# EasyEDA Pro project htx-studio-project_kpilekig-42ad306f.epro, board Adapter
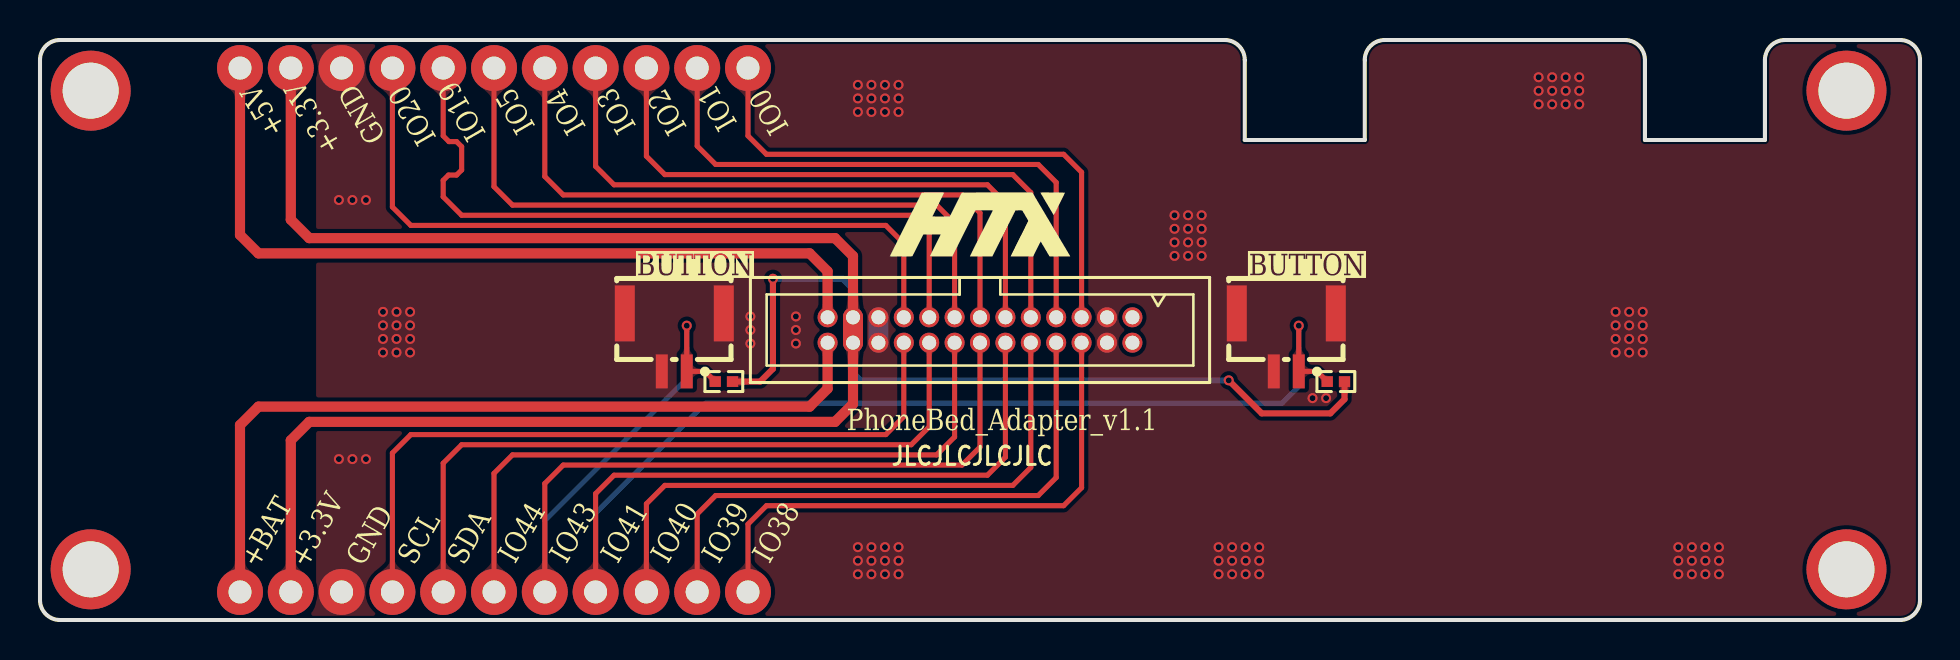
[diagram p10: board, top side]
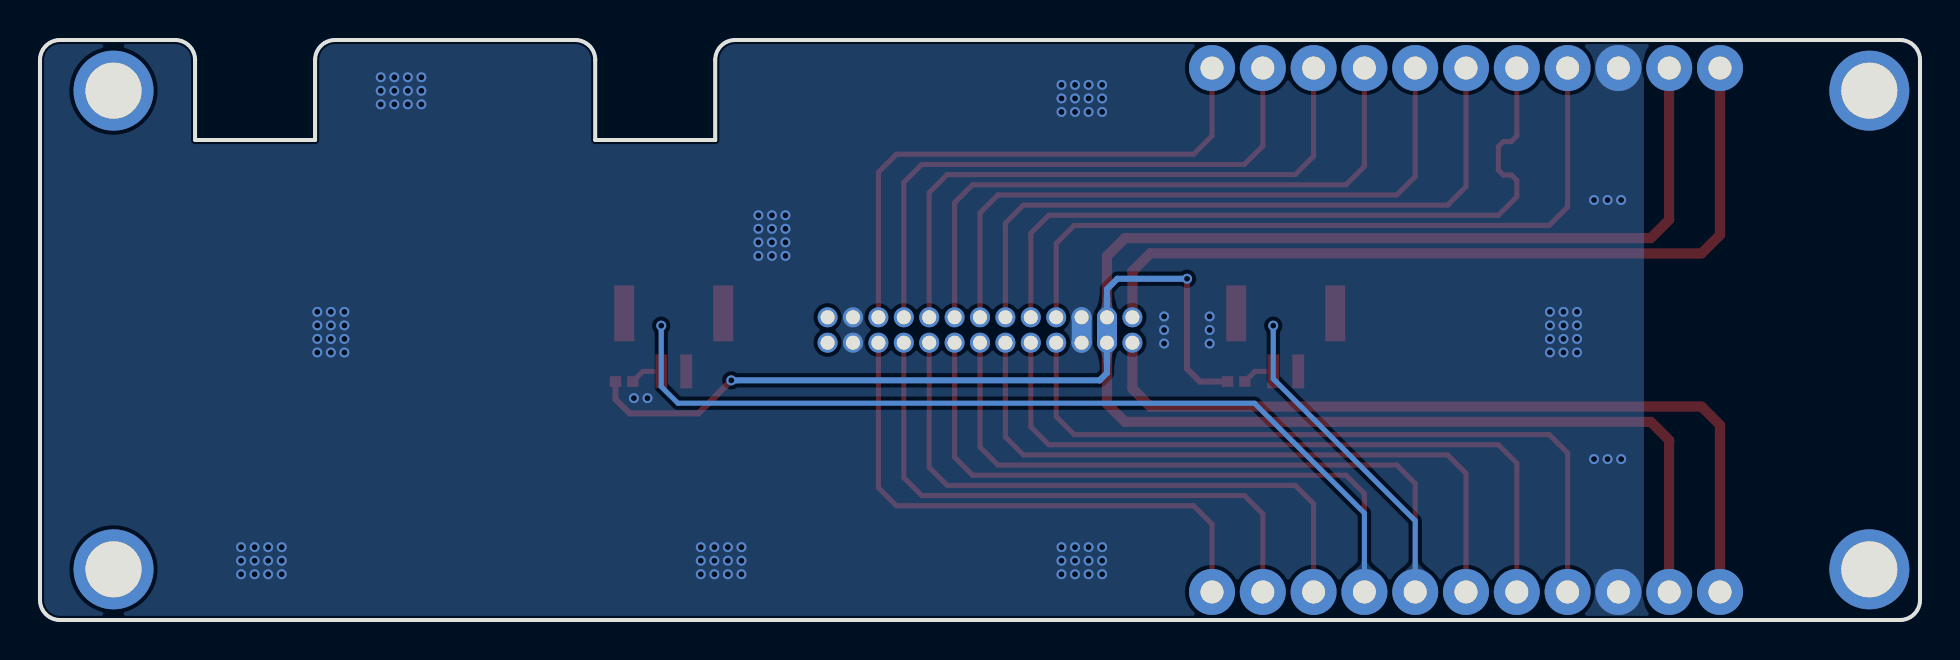
[diagram p11: board, bottom side, seen from below]

Outline 94 x 29 mm; copper layers: Top Layer, Bottom Layer. Coordinates in mm from the lower left corner of the outline.
Outline path: 0,28 arc(0.29,28.71) 1,29 59.24,29 arc(59.95,28.71) 60.24,28 60.24,24 66.24,24 66.24,28 arc(66.53,28.71) 67.24,29 79.25,29 arc(79.95,28.71) 80.25,28 80.25,24 86.25,24 86.25,28 arc(86.54,28.71) 87.25,29 93,29 arc(93.71,28.71) 94,28 94,1 arc(93.71,0.29) 93,0 1,0 arc(0.29,0.29) 0,1 0,28
Stack: Top Layer 0.035mm / Dielectric1 1.51mm FR4 er 4.5 / Bottom Layer 0.035mm

## Design rules (mm)
spacing copperThickness1oz (default): track to track 0.102, other pairs 0.152 to 0.3
spacing copperThickness2oz: track to track 0.203, other pairs 0.152 to 0.3
spacing Plane_innerPlane: track to track 0.102, other pairs 0.152 to 0.3
spacing Copper_copperRegion: track to track 0.102, other pairs 0.152 to 0.3
track width copperThickness1oz (default): min 0.127, default 0.254, max 2.54
track width copperThickness2oz: min 0.203, default 0.254, max 2.54
differential pair differentialPair (default): width min 0.127, default 0.254, max 2.54; gap min 0.152, default 0.152
pour e259 uses Copper_copperRegion
pour e265 uses Copper_copperRegion

## Placement (name value [footprint] x y rotation side)
CN1  X1270WV-2x13A-9TV01  [IDC-TH_X1270WV-2X13A-6TV01]  47 14.5 180 top
CN3  WAFER-GH1.25-2PWB  [CONN-TH_2P-P1.25_XUNPU_WAFER-GH1.25-2PWB]  31.71 13.88 180 top
CN4  WAFER-GH1.25-2PWB  [CONN-TH_2P-P1.25_XUNPU_WAFER-GH1.25-2PWB]  62.31 13.88 180 top
H1  PZ254-1-11-Z-8.5  [HDR-TH_11P-P2.54-V-M]  22.7 27.6 0 top
H2  PZ254-1-11-Z-8.5  [HDR-TH_11P-P2.54-V-M]  22.7 1.4 0 top
NOREF  -  [Pad_e116]  90.32 2.53 0 top
NOREF#2  -  [Pad_e115]  90.32 26.47 0 top
NOREF#3  -  [Pad_e117]  2.53 26.47 0 top
NOREF#4  -  [Pad_e118]  2.53 2.53 0 top
R1  10kΩ  [R0402]  64.79 11.92 0 top
R2  10kΩ  [R0402]  34.19 11.92 0 top

## Footprints (pads in the part's own frame, mm; a bottom-side part is the same pattern mirrored in y, then rotated)
CONN-TH_2P-P1.25_XUNPU_WAFER-GH1.25-2PWB
  rect 0.6x1.7 smd: 1(-0.625,1.45) 2(0.625,1.45)
  rect 1x2.8 smd: 3(-2.475,-1.45) 4(2.475,-1.45)
HDR-TH_11P-P2.54-V-M
  round 2.3 hole 1.15: 1(-12.7,0) 2(-10.16,0) 3(-7.62,0) 4(-5.08,0) 5(-2.54,0) 6(0,0) 7(2.54,0) 8(5.08,0) 9(7.62,0) 10(10.16,0) 11(12.7,0)
IDC-TH_X1270WV-2X13A-6TV01
  round 1 hole 0.7: 1(-7.62,-0.635) 2(-7.62,0.635) 3(-6.35,-0.635) 4(-6.35,0.635) 5(-5.08,-0.635) 6(-5.08,0.635) 7(-3.81,-0.635) 8(-3.81,0.635) 9(-2.54,-0.635) 10(-2.54,0.635) 11(-1.27,-0.635) 12(-1.27,0.635) 13(0,-0.635) 14(0,0.635) 15(1.27,-0.635) 16(1.27,0.635) 17(2.54,-0.635) 18(2.54,0.635) 19(3.81,-0.635) 20(3.81,0.635) 21(5.08,-0.635) 22(5.08,0.635) 23(6.35,-0.635) 24(6.35,0.635) 25(7.62,-0.635) 26(7.62,0.635)
Pad_e115
  round 4 hole 2.8: 1(0,0)
Pad_e116
  round 4 hole 2.8: 1(0,0)
Pad_e117
  round 4 hole 2.8: 1(0,0)
Pad_e118
  round 4 hole 2.8: 1(0,0)
R0402
  rect 0.566x0.54 smd: 1(-0.433,0) 2(0.433,0)

## Nets
As in the schematic.

Pads without a net: CN1 1 2; NOREF 1; NOREF#2 1; NOREF#3 1; NOREF#4 1

## Via types
v1: diameter 0.5, hole 0.3, Top Layer to Bottom Layer, 114 vias

## Routing (per net, layer and track width the routed paths; a pad name or vN(x,y) marks a point on that pad's centre or on a via; arc(x,y) is an arc through that point)
+3.3V: length 122.1
  Top Layer w0.305: R1.2 65.23,11.04 64.52,10.33 61.09,10.33 v1(59.44,11.98) ; R2.2 36.01,11.92 36.65,12.56 v1(36.65,17.06)
  Top Layer w0.508: CN1.24 40.65,10.81 39.75,9.91 13.46,9.91 12.54,8.98 H2.2 ; H1.2 12.54,20.02 13.46,19.09 39.75,19.09 40.65,18.2 CN1.23
  Top Layer w1: CN1.23 CN1.24
  Bottom Layer w0.305: CN1.24 40.65,12.35 41.02,11.98 v1(59.44,11.98) ; CN1.23 40.65,16.54 40.13,17.06 v1(36.65,17.06)
  Bottom Layer w1: CN1.23 CN1.24
+5V: length 40.8
  Top Layer w0.508: CN1.25 39.38,17.43 38.48,18.33 10.92,18.33 10,19.25 10,27.6
GND: length 1.3
  Bottom Layer w1: CN1.22 CN1.21
  vias: v1(14.94,21) v1(14.94,8.05) v1(15.62,21) v1(15.62,8.05) v1(16.3,21) v1(16.3,8.05) v1(17.15,15.41) v1(17.15,14.73) v1(17.15,14.05) v1(17.15,13.38) v1(17.83,15.41) v1(17.83,14.73) v1(17.83,14.05) v1(17.83,13.38) v1(18.5,15.41) v1(18.5,14.73) v1(18.5,14.05) v1(18.5,13.38) v1(35.52,15.18) v1(35.52,14.5) v1(35.52,13.82) v1(37.79,15.18) v1(37.79,14.5) v1(37.79,13.82) v1(40.89,26.76) v1(40.89,26.08) v1(40.89,25.4) v1(40.89,3.64) v1(40.89,2.97) v1(40.89,2.29) v1(41.57,26.76) v1(41.57,26.08) v1(41.57,25.4) v1(41.57,3.64) v1(41.57,2.97) v1(41.57,2.29) v1(42.25,26.76) v1(42.25,26.08) v1(42.25,25.4) v1(42.25,3.64) v1(42.25,2.97) v1(42.25,2.29) v1(42.93,26.76) v1(42.93,26.08) v1(42.93,25.4) v1(42.93,3.64) v1(42.93,2.97) v1(42.93,2.29) v1(56.73,20.24) v1(56.73,19.56) v1(56.73,18.88) v1(56.73,18.21) v1(57.4,20.24) v1(57.4,19.56) v1(57.4,18.88) v1(57.4,18.21) v1(58.08,20.24) v1(58.08,19.56) v1(58.08,18.88) v1(58.08,18.21) v1(58.93,3.64) v1(58.93,2.97) v1(58.93,2.29) v1(59.61,3.64) v1(59.61,2.97) v1(59.61,2.29) v1(60.28,3.64) v1(60.28,2.97) v1(60.28,2.29) v1(60.96,3.64) v1(60.96,2.97) v1(60.96,2.29) v1(63.63,11.09) v1(64.3,11.09) v1(74.93,27.14) v1(74.93,26.46) v1(74.93,25.78) v1(75.61,27.14) v1(75.61,26.46) v1(75.61,25.78) v1(76.28,27.14) v1(76.28,26.46) v1(76.28,25.78) v1(76.96,27.14) v1(76.96,26.46) v1(76.96,25.78) v1(78.78,15.41) v1(78.78,14.73) v1(78.78,14.05) v1(78.78,13.38) v1(79.46,15.41) v1(79.46,14.73) v1(79.46,14.05) v1(79.46,13.38) v1(80.13,15.41) v1(80.13,14.73) v1(80.13,14.05) v1(80.13,13.38) v1(81.91,3.64) v1(81.91,2.97) v1(81.91,2.29) v1(82.59,3.64) v1(82.59,2.97) v1(82.59,2.29) v1(83.27,3.64) v1(83.27,2.97) v1(83.27,2.29) v1(83.95,3.64) v1(83.95,2.97) v1(83.95,2.29)
+BAT: length 40.8
  Top Layer w0.508: CN1.26 39.38,11.57 38.48,10.67 10.92,10.67 10,9.75 10,1.4
GPIO0: length 28.1
  Top Layer w0.254: CN1.5 52.08,22.39 51.18,23.29 36.32,23.29 35.4,24.21 35.4,27.6
GPIO1: length 29.3
  Top Layer w0.254: H1.10 32.86,23.7 33.78,22.78 49.91,22.78 50.81,21.88 CN1.7
GPIO2: length 30.6
  Top Layer w0.254: H1.9 30.32,23.19 31.24,22.27 48.64,22.27 49.54,21.37 CN1.9
GPIO3: length 31.9
  Top Layer w0.254: 27.78,27.6 27.78,22.68 28.7,21.76 47.37,21.76 48.27,20.86 CN1.11
GPIO4: length 33.2
  Top Layer w0.254: H1.7 25.24,22.18 26.16,21.25 46.1,21.25 47,20.35 CN1.13
GPIO5: length 34.4
  Top Layer w0.254: H1.6 22.7,21.67 23.62,20.75 44.83,20.75 45.73,19.85 CN1.15
GPIO19: length 36.9
  Top Layer w0.254: 20.16,27.6 20.16,24.21 20.45,23.92 20.83,23.92 21.08,23.67 21.08,22.5 20.83,22.25 20.42,22.25 20.16,21.98 20.16,21.16 21.08,20.24 43.56,20.24 44.46,19.34 CN1.17
GPIO20: length 37
  Top Layer w0.254: CN1.19 43.19,18.83 42.29,19.73 18.54,19.73 17.62,20.65 H1.4
GPIO38: length 28.1
  Top Layer w0.254: CN1.6 52.08,6.61 51.18,5.72 36.32,5.72 35.4,4.79 35.4,1.4
GPIO39: length 29.3
  Top Layer w0.254: H2.10 32.86,5.3 33.78,6.22 49.91,6.22 50.81,7.12 CN1.8
GPIO40: length 30.6
  Top Layer w0.254: H2.9 30.32,5.81 31.24,6.73 48.64,6.73 49.54,7.63 CN1.10
GPIO41: length 80.6
  Top Layer w0.254: CN1.12 48.27,8.14 47.37,7.24 28.7,7.24 27.78,6.32 27.78,1.4 ; R1.1 63.85,12.43 CN4.1 v1(62.94,14.72)
  Bottom Layer w0.254: v1(62.94,14.72) 62.94,11.67 62.1,10.84 33.27,10.84 27.78,5.35 27.78,1.4
GPIO43: length 53.3
  Top Layer w0.254: v1(32.34,14.72) CN3.1 33.25,12.43 R2.1 ; H2.7 25.24,6.83 26.16,7.75 46.1,7.75 47,8.65 CN1.14
  Bottom Layer w0.254: H2.7 25.24,4.96 32.34,12.06 v1(32.34,14.72)
GPIO44: length 34.4
  Top Layer w0.254: CN1.16 45.73,9.15 44.83,8.26 23.62,8.26 22.7,7.33 H2.6
SCL: length 37
  Top Layer w0.254: H2.4 17.62,8.35 18.54,9.27 42.29,9.27 43.19,10.17 CN1.20
SDA: length 35.7
  Top Layer w0.254: 20.16,1.4 20.16,7.84 21.08,8.76 43.56,8.76 44.46,9.66 CN1.18

## Copper pours and planes (outline as drawn; the poured copper is in the pictures)
GND on Top Layer: 79.25,29 79.95,28.71 80.25,28 80.25,24 86.25,24 86.25,28 86.54,28.71 87.25,29 93,29 93.71,28.71 94,28 94,1 93.71,0.29 93,0 1,0 0.29,0.29 0,1 0,28 0.29,28.71 1,29 59.24,29 59.95,28.71 60.24,28 60.24,24 66.24,24 66.24,28 66.53,28.71 67.24,29
GND on Bottom Layer: 79.25,29 79.95,28.71 80.25,28 80.25,24 86.25,24 86.25,28 86.54,28.71 87.25,29 93,29 93.71,28.71 94,28 94,1 93.71,0.29 93,0 1,0 0.29,0.29 0,1 0,28 0.29,28.71 1,29 59.24,29 59.95,28.71 60.24,28 60.24,24 66.24,24 66.24,28 66.53,28.71 67.24,29

Small or netless copper shapes (teardrops, artwork), in the pictures only: 54 on Top Layer, 10 on Bottom Layer

## Text on the board
Top Silkscreen Layer: JLCJLCJLCJLC | BUTTON | PhoneBed_Adapter_v1.1 | +BAT | +3.3V | GND | SCL | SDA | IO44 | IO43 | IO41 | IO40 | IO39 | IO38 | +5V | IO20 | IO19 | IO5 | IO4 | IO3 | IO2 | IO1 | IO0
